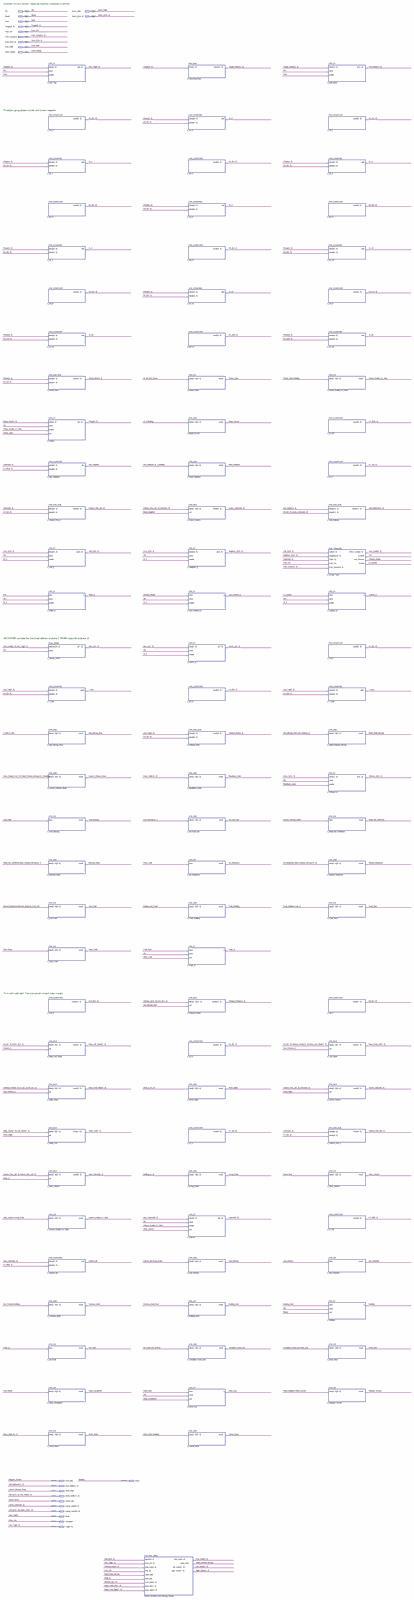
[diagram p0: schematic sheet, whole]
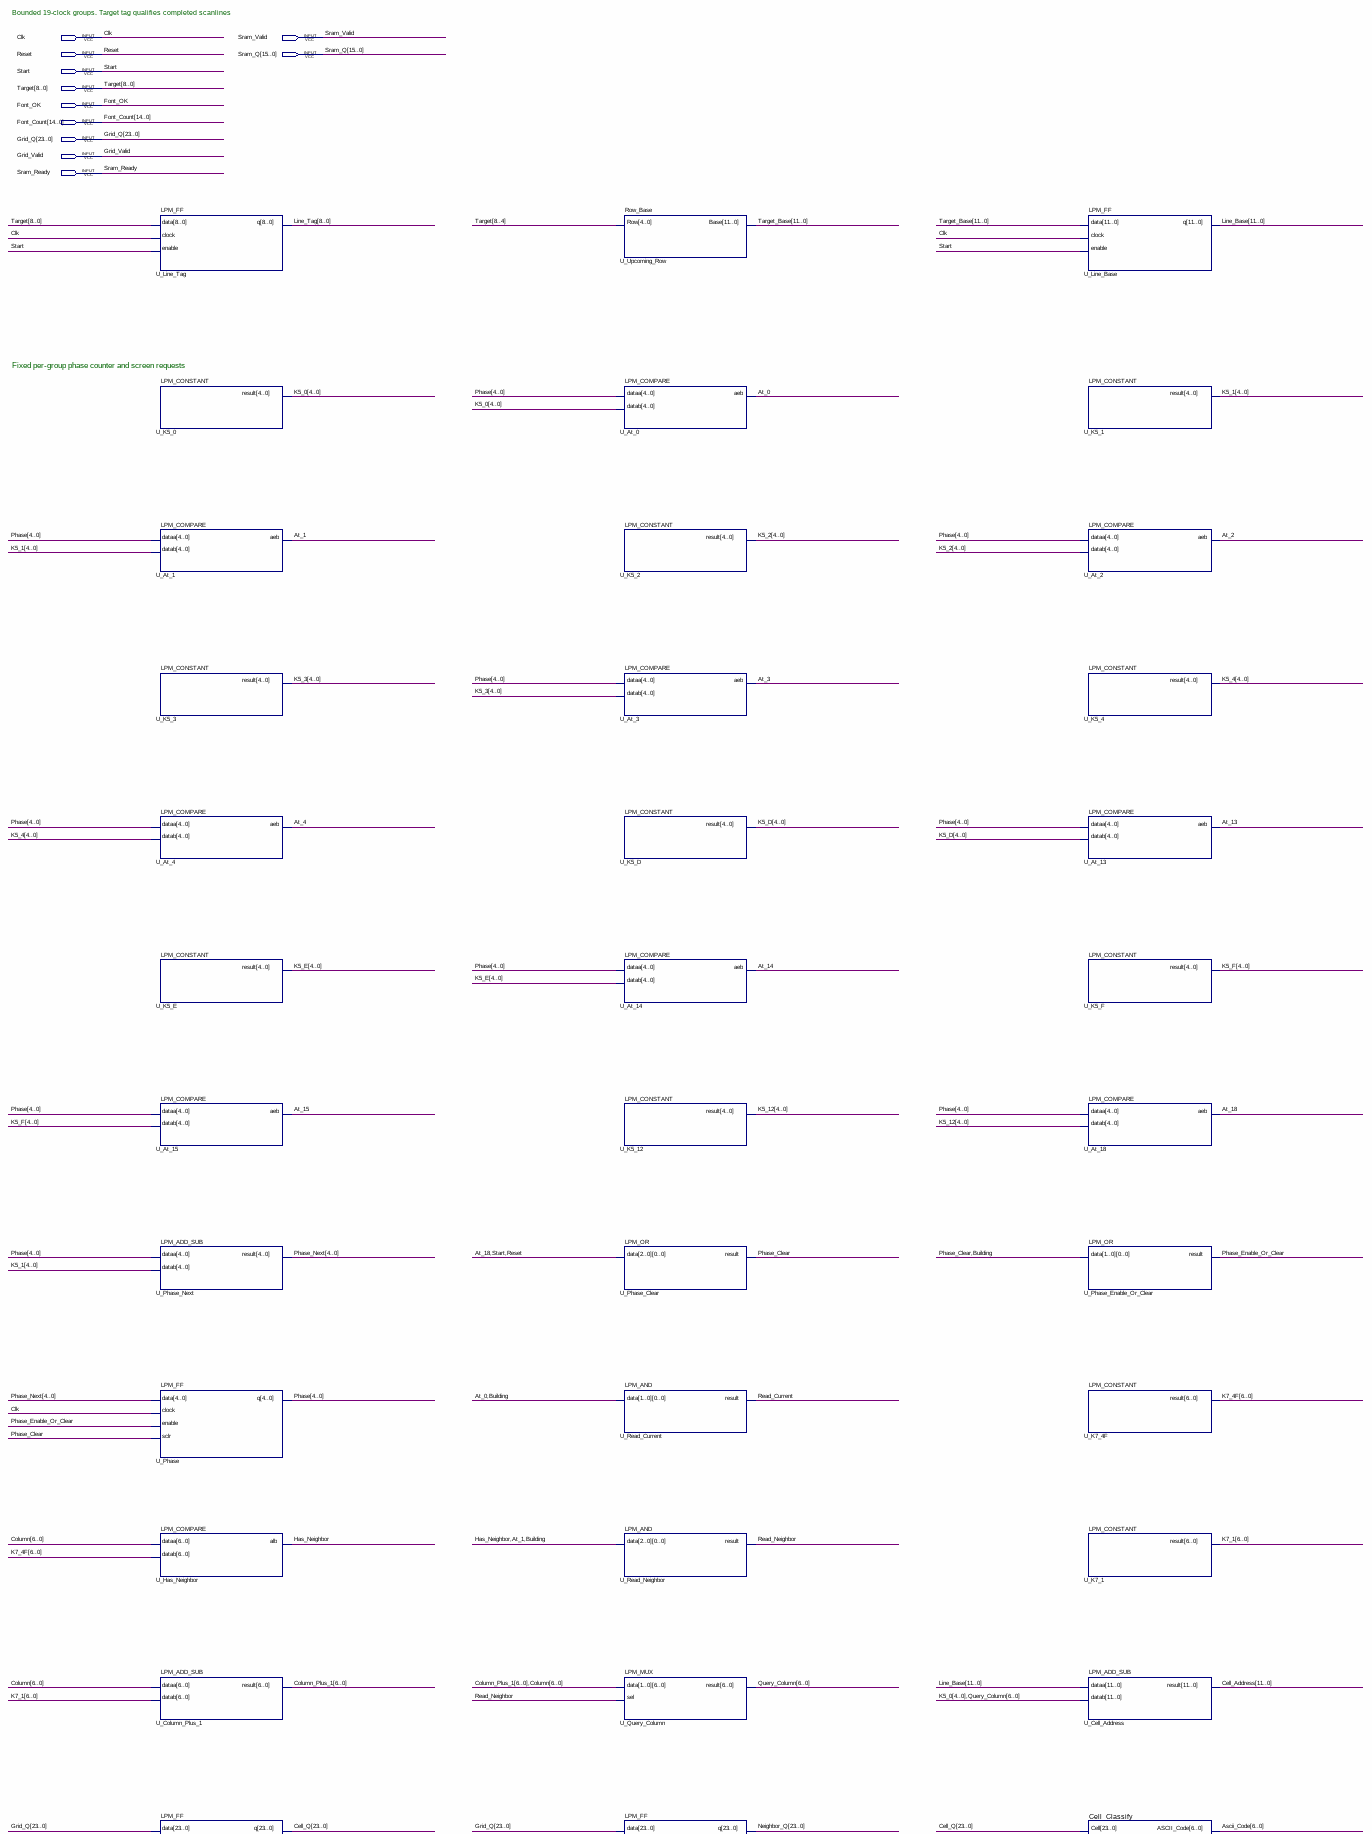
[diagram p1: schematic sheet, upper part]
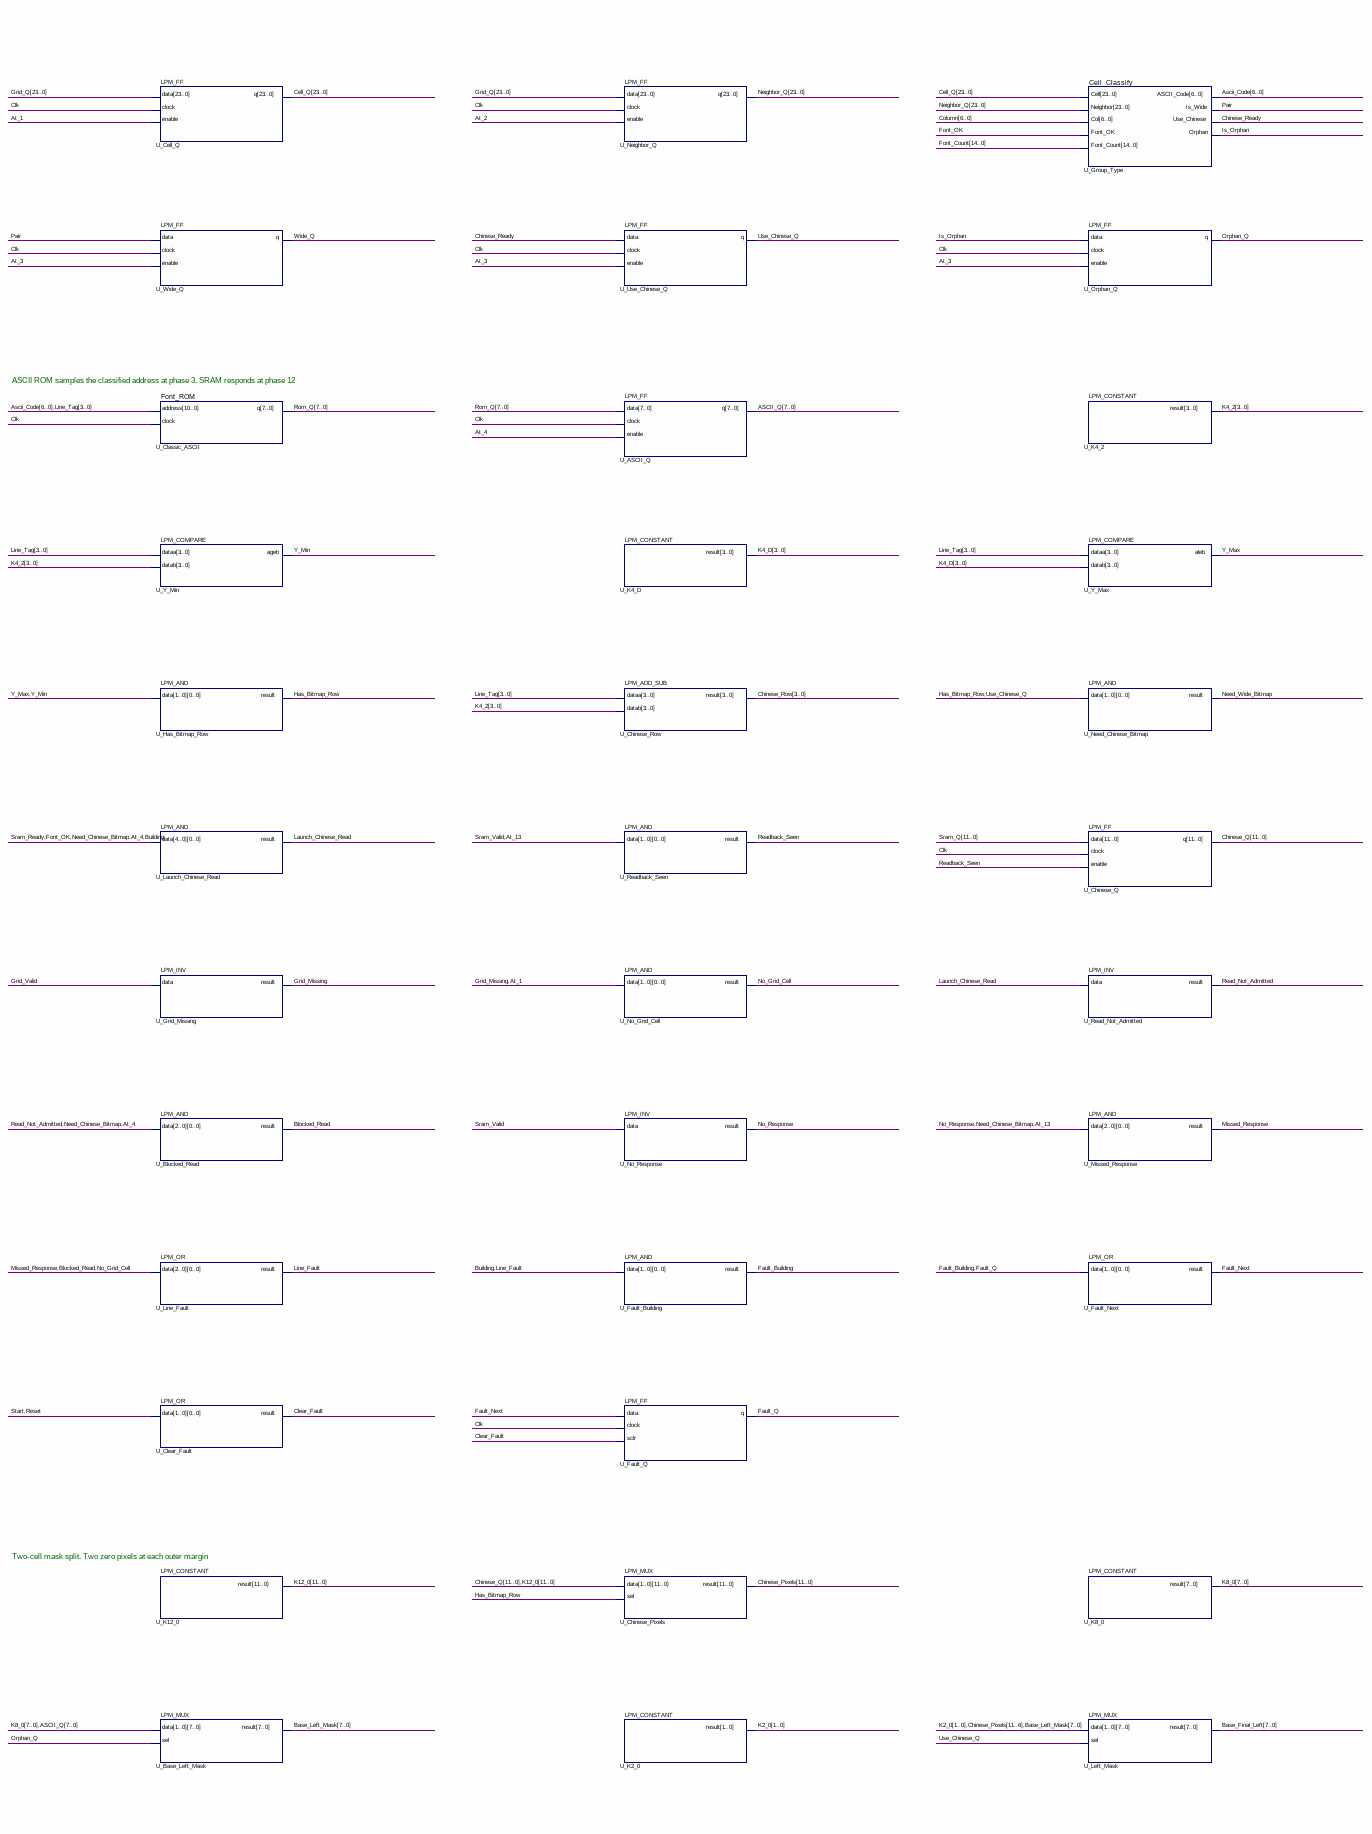
[diagram p2: schematic sheet, middle part]
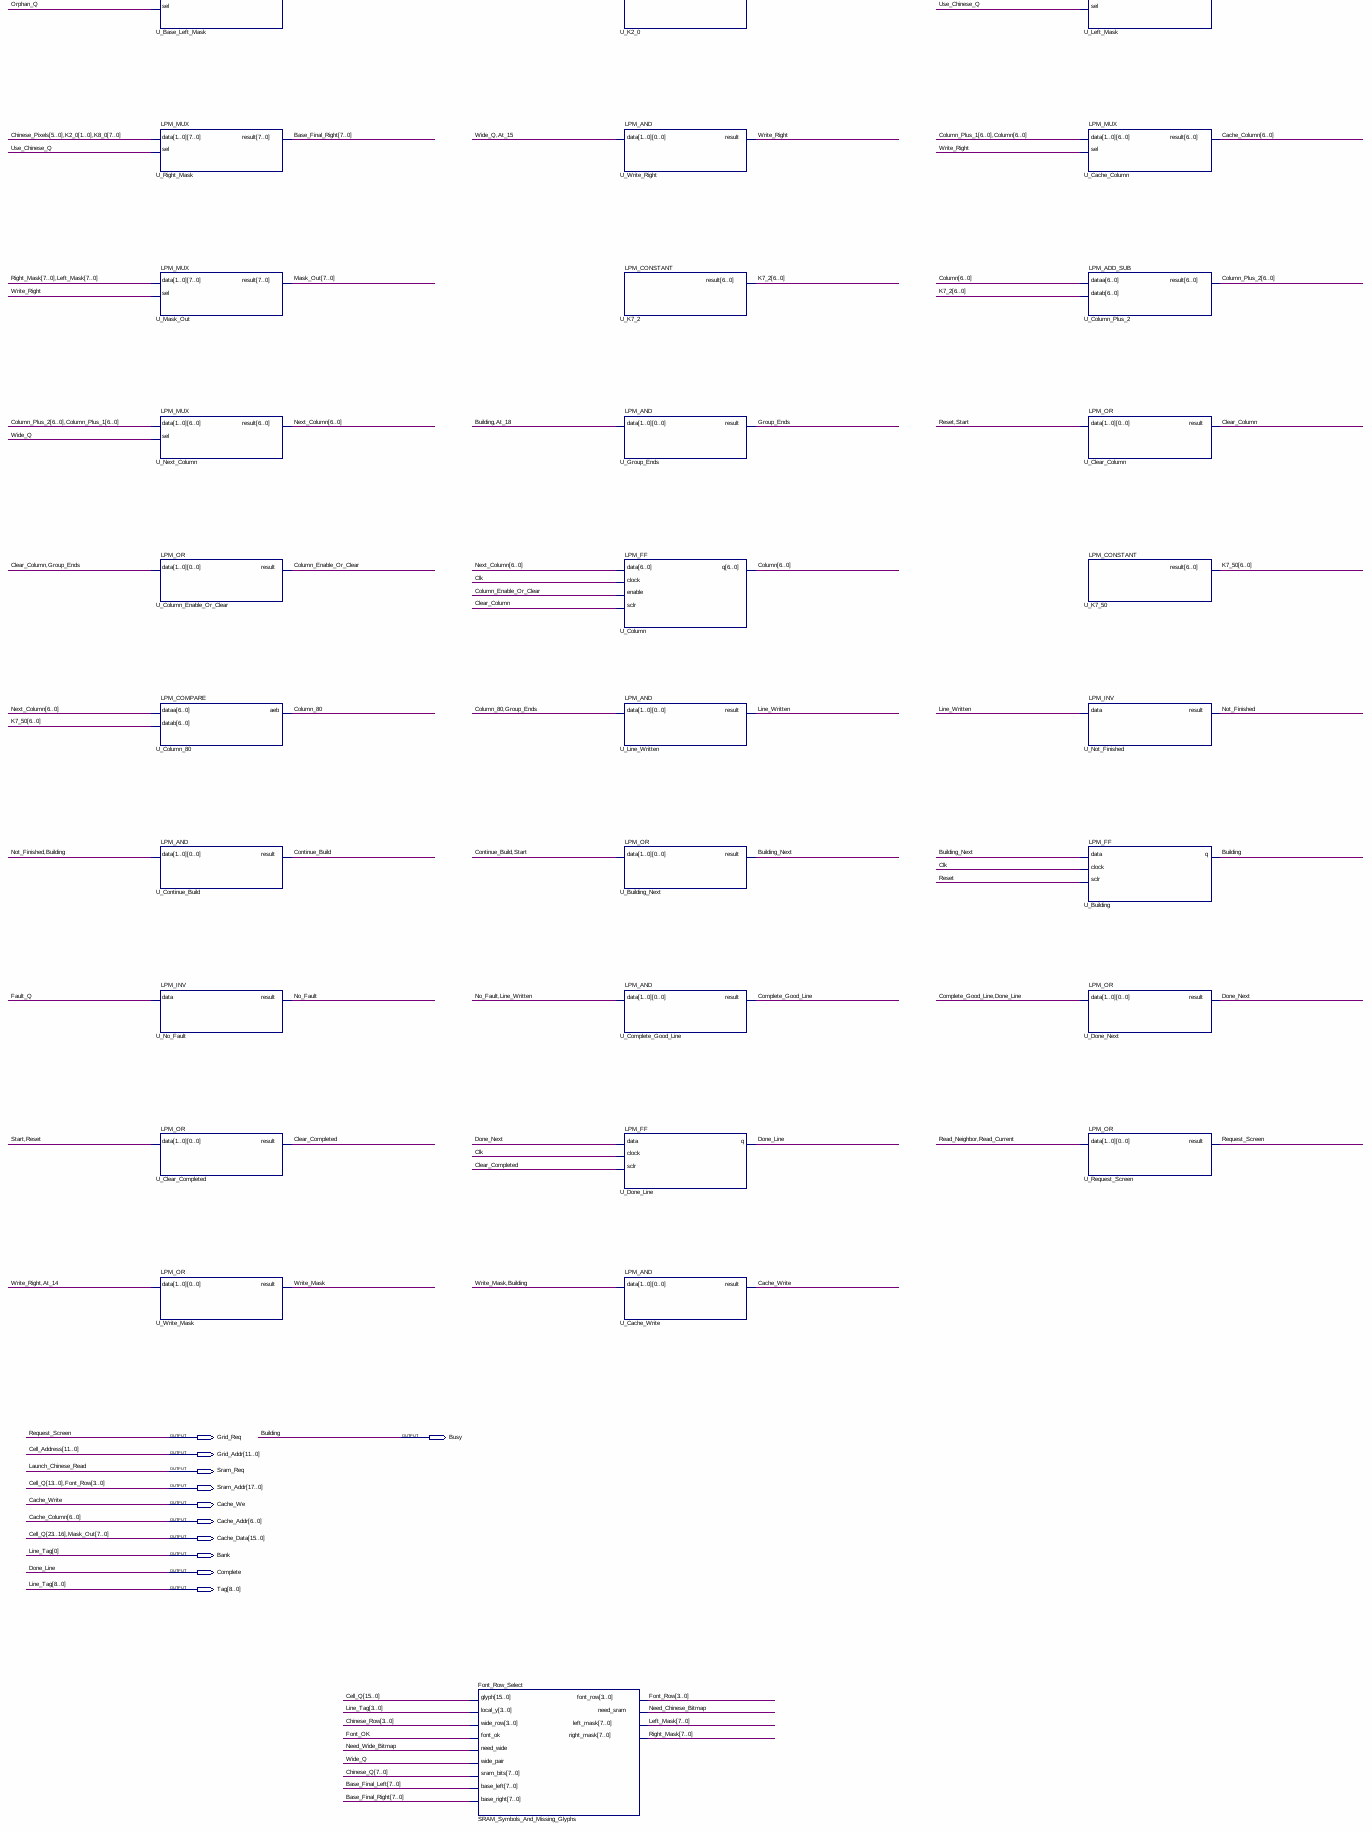
[diagram p3: schematic sheet, lower part]
// Quartus schematic Scanline_Builder.bdf as structural Verilog: 95 symbols, 22 pins
module Scanline_Builder (
  input  Clk,
  input  Sram_Valid,
  input  Reset,
  input  [15:0] Sram_Q,
  input  Start,
  input  [8:0] Target,
  input  Font_OK,
  input  [14:0] Font_Count,
  input  [23:0] Grid_Q,
  input  Grid_Valid,
  input  Sram_Ready,
  output Grid_Req,
  output Busy,
  output [11:0] Grid_Addr,
  output Sram_Req,
  output [17:0] Sram_Addr,
  output Cache_We,
  output [6:0] Cache_Addr,
  output [15:0] Cache_Data,
  output Bank,
  output Complete,
  output [8:0] Tag
);

  wire At_0, At_1, At_2, At_3, At_4, At_13, At_14, At_15, At_18, Blocked_Read, Building_Next, Chinese_Ready,
       Clear_Column, Clear_Completed, Clear_Fault, Column_80, Column_Enable_Or_Clear, Complete_Good_Line,
       Continue_Build, Done_Next, Fault_Building, Fault_Next, Fault_Q, Grid_Missing, Group_Ends,
       Has_Bitmap_Row, Has_Neighbor, Is_Orphan, Line_Fault, Line_Written, Missed_Response,
       Need_Chinese_Bitmap, Need_Wide_Bitmap, No_Fault, No_Grid_Cell, No_Response, Not_Finished, Orphan_Q,
       Pair, Phase_Clear, Phase_Enable_Or_Clear, Read_Current, Read_Neighbor, Read_Not_Admitted,
       Readback_Seen, Use_Chinese_Q, Wide_Q, Write_Mask, Write_Right, Y_Max, Y_Min;
  wire [1:0] K2_0;
  wire [3:0] Chinese_Row, K4_2, K4_D;
  wire [4:0] K5_0, K5_1, K5_2, K5_3, K5_4, K5_12, K5_D, K5_E, K5_F, Phase, Phase_Next;
  wire [6:0] Ascii_Code, Column, Column_Plus_1, Column_Plus_2, K7_1, K7_2, K7_4F, K7_50, Next_Column,
       Query_Column;
  wire [7:0] ASCII_Q, Base_Final_Left, Base_Final_Right, Base_Left_Mask, K8_0, Left_Mask, Right_Mask, Rom_Q;
  wire [11:0] Chinese_Pixels, Chinese_Q, K12_0, Line_Base, Target_Base;
  wire [15:14] Cell_Q;
  wire [23:0] Neighbor_Q;

  LPM_FF #(.LPM_WIDTH(9), .LPM_FFTYPE("DFF")) U_Line_Tag (
    .data(Target), .clock(Clk), .enable(Start), .q({Tag[8:1], Bank}));
  LPM_CONSTANT #(.LPM_WIDTH(5), .LPM_CVALUE(0)) U_K5_0 (.result(K5_0));
  LPM_COMPARE #(.LPM_WIDTH(5), .LPM_REPRESENTATION("UNSIGNED")) U_At_1 (.dataa(Phase), .datab(K5_1), .aeb(At_1));
  LPM_CONSTANT #(.LPM_WIDTH(5), .LPM_CVALUE(3)) U_K5_3 (.result(K5_3));
  LPM_COMPARE #(.LPM_WIDTH(5), .LPM_REPRESENTATION("UNSIGNED")) U_At_4 (.dataa(Phase), .datab(K5_4), .aeb(At_4));
  LPM_CONSTANT #(.LPM_WIDTH(5), .LPM_CVALUE(14)) U_K5_E (.result(K5_E));
  LPM_COMPARE #(.LPM_WIDTH(5), .LPM_REPRESENTATION("UNSIGNED")) U_At_15 (.dataa(Phase), .datab(K5_F), .aeb(At_15));
  LPM_ADD_SUB #(.LPM_WIDTH(5), .LPM_DIRECTION("ADD"), .LPM_REPRESENTATION("UNSIGNED")) U_Phase_Next (
    .dataa(Phase), .datab(K5_1), .result(Phase_Next));
  LPM_FF #(.LPM_WIDTH(5), .LPM_FFTYPE("DFF")) U_Phase (
    .data(Phase_Next), .clock(Clk), .enable(Phase_Enable_Or_Clear), .sclr(Phase_Clear), .q(Phase));
  LPM_COMPARE #(.LPM_WIDTH(7), .LPM_REPRESENTATION("UNSIGNED")) U_Has_Neighbor (
    .dataa(Column), .datab(K7_4F), .alb(Has_Neighbor));
  LPM_ADD_SUB #(.LPM_WIDTH(7), .LPM_DIRECTION("ADD"), .LPM_REPRESENTATION("UNSIGNED")) U_Column_Plus_1 (
    .dataa(Column), .datab(K7_1), .result(Column_Plus_1));
  LPM_FF #(.LPM_WIDTH(24), .LPM_FFTYPE("DFF")) U_Cell_Q (
    .data(Grid_Q), .clock(Clk), .enable(At_1), .q({Cache_Data[15:8], Cell_Q, Sram_Addr[17:4]}));
  LPM_FF #(.LPM_WIDTH(1), .LPM_FFTYPE("DFF")) U_Wide_Q (.data(Pair), .clock(Clk), .enable(At_3), .q(Wide_Q));
  Font_ROM U_Classic_ASCII (.address({Ascii_Code, Tag[3:1], Bank}), .clock(Clk), .q(Rom_Q));
  LPM_COMPARE #(.LPM_WIDTH(4), .LPM_REPRESENTATION("UNSIGNED")) U_Y_Min (
    .dataa({Tag[3:1], Bank}), .datab(K4_2), .ageb(Y_Min));
  LPM_AND #(.LPM_WIDTH(1), .LPM_SIZE(2)) U_Has_Bitmap_Row (.data({Y_Max, Y_Min}), .result(Has_Bitmap_Row));
  LPM_AND #(.LPM_WIDTH(1), .LPM_SIZE(5)) U_Launch_Chinese_Read (
    .data({Sram_Ready, Font_OK, Need_Chinese_Bitmap, At_4, Busy}), .result(Sram_Req));
  LPM_INV #(.LPM_WIDTH(1)) U_Grid_Missing (.data(Grid_Valid), .result(Grid_Missing));
  LPM_AND #(.LPM_WIDTH(1), .LPM_SIZE(3)) U_Blocked_Read (
    .data({Read_Not_Admitted, Need_Chinese_Bitmap, At_4}), .result(Blocked_Read));
  LPM_OR #(.LPM_WIDTH(1), .LPM_SIZE(3)) U_Line_Fault (
    .data({Missed_Response, Blocked_Read, No_Grid_Cell}), .result(Line_Fault));
  LPM_OR #(.LPM_WIDTH(1), .LPM_SIZE(2)) U_Clear_Fault (.data({Start, Reset}), .result(Clear_Fault));
  LPM_CONSTANT #(.LPM_WIDTH(12), .LPM_CVALUE(0)) U_K12_0 (.result(K12_0));
  LPM_MUX #(.LPM_WIDTH(8), .LPM_SIZE(2), .LPM_WIDTHS(1)) U_Base_Left_Mask (
    .data({K8_0, ASCII_Q}), .sel(Orphan_Q), .result(Base_Left_Mask));
  LPM_MUX #(.LPM_WIDTH(8), .LPM_SIZE(2), .LPM_WIDTHS(1)) U_Right_Mask (
    .data({Chinese_Pixels[5:0], K2_0, K8_0}), .sel(Use_Chinese_Q), .result(Base_Final_Right));
  LPM_MUX #(.LPM_WIDTH(8), .LPM_SIZE(2), .LPM_WIDTHS(1)) U_Mask_Out (
    .data({Right_Mask, Left_Mask}), .sel(Write_Right), .result(Cache_Data[7:0]));
  LPM_MUX #(.LPM_WIDTH(7), .LPM_SIZE(2), .LPM_WIDTHS(1)) U_Next_Column (
    .data({Column_Plus_2, Column_Plus_1}), .sel(Wide_Q), .result(Next_Column));
  LPM_OR #(.LPM_WIDTH(1), .LPM_SIZE(2)) U_Column_Enable_Or_Clear (
    .data({Clear_Column, Group_Ends}), .result(Column_Enable_Or_Clear));
  LPM_COMPARE #(.LPM_WIDTH(7), .LPM_REPRESENTATION("UNSIGNED")) U_Column_80 (
    .dataa(Next_Column), .datab(K7_50), .aeb(Column_80));
  LPM_AND #(.LPM_WIDTH(1), .LPM_SIZE(2)) U_Continue_Build (.data({Not_Finished, Busy}), .result(Continue_Build));
  LPM_INV #(.LPM_WIDTH(1)) U_No_Fault (.data(Fault_Q), .result(No_Fault));
  LPM_OR #(.LPM_WIDTH(1), .LPM_SIZE(2)) U_Clear_Completed (.data({Start, Reset}), .result(Clear_Completed));
  LPM_OR #(.LPM_WIDTH(1), .LPM_SIZE(2)) U_Write_Mask (.data({Write_Right, At_14}), .result(Write_Mask));
  Font_Row_Select SRAM_Symbols_And_Missing_Glyphs (
    .glyph({Cell_Q, Sram_Addr[17:4]}), .local_y({Tag[3:1], Bank}), .wide_row(Chinese_Row), .font_ok(Font_OK),
    .need_wide(Need_Wide_Bitmap), .wide_pair(Wide_Q), .sram_bits(Chinese_Q[7:0]),
    .base_left(Base_Final_Left), .base_right(Base_Final_Right), .font_row(Sram_Addr[3:0]),
    .need_sram(Need_Chinese_Bitmap), .left_mask(Left_Mask), .right_mask(Right_Mask));
  Row_Base U_Upcoming_Row (.Row(Target[8:4]), .Base(Target_Base));
  LPM_COMPARE #(.LPM_WIDTH(5), .LPM_REPRESENTATION("UNSIGNED")) U_At_0 (.dataa(Phase), .datab(K5_0), .aeb(At_0));
  LPM_CONSTANT #(.LPM_WIDTH(5), .LPM_CVALUE(2)) U_K5_2 (.result(K5_2));
  LPM_COMPARE #(.LPM_WIDTH(5), .LPM_REPRESENTATION("UNSIGNED")) U_At_3 (.dataa(Phase), .datab(K5_3), .aeb(At_3));
  LPM_CONSTANT #(.LPM_WIDTH(5), .LPM_CVALUE(13)) U_K5_D (.result(K5_D));
  LPM_COMPARE #(.LPM_WIDTH(5), .LPM_REPRESENTATION("UNSIGNED")) U_At_14 (.dataa(Phase), .datab(K5_E), .aeb(At_14));
  LPM_CONSTANT #(.LPM_WIDTH(5), .LPM_CVALUE(18)) U_K5_12 (.result(K5_12));
  LPM_OR #(.LPM_WIDTH(1), .LPM_SIZE(3)) U_Phase_Clear (.data({At_18, Start, Reset}), .result(Phase_Clear));
  LPM_AND #(.LPM_WIDTH(1), .LPM_SIZE(2)) U_Read_Current (.data({At_0, Busy}), .result(Read_Current));
  LPM_AND #(.LPM_WIDTH(1), .LPM_SIZE(3)) U_Read_Neighbor (.data({Has_Neighbor, At_1, Busy}), .result(Read_Neighbor));
  LPM_MUX #(.LPM_WIDTH(7), .LPM_SIZE(2), .LPM_WIDTHS(1)) U_Query_Column (
    .data({Column_Plus_1, Column}), .sel(Read_Neighbor), .result(Query_Column));
  LPM_FF #(.LPM_WIDTH(24), .LPM_FFTYPE("DFF")) U_Neighbor_Q (.data(Grid_Q), .clock(Clk), .enable(At_2), .q(Neighbor_Q));
  LPM_FF #(.LPM_WIDTH(1), .LPM_FFTYPE("DFF")) U_Use_Chinese_Q (
    .data(Chinese_Ready), .clock(Clk), .enable(At_3), .q(Use_Chinese_Q));
  LPM_FF #(.LPM_WIDTH(8), .LPM_FFTYPE("DFF")) U_ASCII_Q (.data(Rom_Q), .clock(Clk), .enable(At_4), .q(ASCII_Q));
  LPM_CONSTANT #(.LPM_WIDTH(4), .LPM_CVALUE(13)) U_K4_D (.result(K4_D));
  LPM_ADD_SUB #(.LPM_WIDTH(4), .LPM_DIRECTION("SUB"), .LPM_REPRESENTATION("UNSIGNED")) U_Chinese_Row (
    .dataa({Tag[3:1], Bank}), .datab(K4_2), .result(Chinese_Row));
  LPM_AND #(.LPM_WIDTH(1), .LPM_SIZE(2)) U_Readback_Seen (.data({Sram_Valid, At_13}), .result(Readback_Seen));
  LPM_AND #(.LPM_WIDTH(1), .LPM_SIZE(2)) U_No_Grid_Cell (.data({Grid_Missing, At_1}), .result(No_Grid_Cell));
  LPM_INV #(.LPM_WIDTH(1)) U_No_Response (.data(Sram_Valid), .result(No_Response));
  LPM_AND #(.LPM_WIDTH(1), .LPM_SIZE(2)) U_Fault_Building (.data({Busy, Line_Fault}), .result(Fault_Building));
  LPM_FF #(.LPM_WIDTH(1), .LPM_FFTYPE("DFF")) U_Fault_Q (
    .data(Fault_Next), .clock(Clk), .sclr(Clear_Fault), .q(Fault_Q));
  LPM_MUX #(.LPM_WIDTH(12), .LPM_SIZE(2), .LPM_WIDTHS(1)) U_Chinese_Pixels (
    .data({Chinese_Q, K12_0}), .sel(Has_Bitmap_Row), .result(Chinese_Pixels));
  LPM_CONSTANT #(.LPM_WIDTH(2), .LPM_CVALUE(0)) U_K2_0 (.result(K2_0));
  LPM_AND #(.LPM_WIDTH(1), .LPM_SIZE(2)) U_Write_Right (.data({Wide_Q, At_15}), .result(Write_Right));
  LPM_CONSTANT #(.LPM_WIDTH(7), .LPM_CVALUE(2)) U_K7_2 (.result(K7_2));
  LPM_AND #(.LPM_WIDTH(1), .LPM_SIZE(2)) U_Group_Ends (.data({Busy, At_18}), .result(Group_Ends));
  LPM_FF #(.LPM_WIDTH(7), .LPM_FFTYPE("DFF")) U_Column (
    .data(Next_Column), .clock(Clk), .enable(Column_Enable_Or_Clear), .sclr(Clear_Column), .q(Column));
  LPM_AND #(.LPM_WIDTH(1), .LPM_SIZE(2)) U_Line_Written (.data({Column_80, Group_Ends}), .result(Line_Written));
  LPM_OR #(.LPM_WIDTH(1), .LPM_SIZE(2)) U_Building_Next (.data({Continue_Build, Start}), .result(Building_Next));
  LPM_AND #(.LPM_WIDTH(1), .LPM_SIZE(2)) U_Complete_Good_Line (
    .data({No_Fault, Line_Written}), .result(Complete_Good_Line));
  LPM_FF #(.LPM_WIDTH(1), .LPM_FFTYPE("DFF")) U_Done_Line (
    .data(Done_Next), .clock(Clk), .sclr(Clear_Completed), .q(Complete));
  LPM_AND #(.LPM_WIDTH(1), .LPM_SIZE(2)) U_Cache_Write (.data({Write_Mask, Busy}), .result(Cache_We));
  LPM_FF #(.LPM_WIDTH(12), .LPM_FFTYPE("DFF")) U_Line_Base (
    .data(Target_Base), .clock(Clk), .enable(Start), .q(Line_Base));
  LPM_CONSTANT #(.LPM_WIDTH(5), .LPM_CVALUE(1)) U_K5_1 (.result(K5_1));
  LPM_COMPARE #(.LPM_WIDTH(5), .LPM_REPRESENTATION("UNSIGNED")) U_At_2 (.dataa(Phase), .datab(K5_2), .aeb(At_2));
  LPM_CONSTANT #(.LPM_WIDTH(5), .LPM_CVALUE(4)) U_K5_4 (.result(K5_4));
  LPM_COMPARE #(.LPM_WIDTH(5), .LPM_REPRESENTATION("UNSIGNED")) U_At_13 (.dataa(Phase), .datab(K5_D), .aeb(At_13));
  LPM_CONSTANT #(.LPM_WIDTH(5), .LPM_CVALUE(15)) U_K5_F (.result(K5_F));
  LPM_COMPARE #(.LPM_WIDTH(5), .LPM_REPRESENTATION("UNSIGNED")) U_At_18 (.dataa(Phase), .datab(K5_12), .aeb(At_18));
  LPM_OR #(.LPM_WIDTH(1), .LPM_SIZE(2)) U_Phase_Enable_Or_Clear (
    .data({Phase_Clear, Busy}), .result(Phase_Enable_Or_Clear));
  LPM_CONSTANT #(.LPM_WIDTH(7), .LPM_CVALUE(79)) U_K7_4F (.result(K7_4F));
  LPM_CONSTANT #(.LPM_WIDTH(7), .LPM_CVALUE(1)) U_K7_1 (.result(K7_1));
  LPM_ADD_SUB #(.LPM_WIDTH(12), .LPM_DIRECTION("ADD"), .LPM_REPRESENTATION("UNSIGNED")) U_Cell_Address (
    .dataa(Line_Base), .datab({K5_0, Query_Column}), .result(Grid_Addr));
  Cell_Classify U_Group_Type (
    .Cell({Cache_Data[15:8], Cell_Q, Sram_Addr[17:4]}), .Neighbor(Neighbor_Q), .Col(Column),
    .Font_OK(Font_OK), .Font_Count(Font_Count), .ASCII_Code(Ascii_Code), .Is_Wide(Pair),
    .Use_Chinese(Chinese_Ready), .Orphan(Is_Orphan));
  LPM_FF #(.LPM_WIDTH(1), .LPM_FFTYPE("DFF")) U_Orphan_Q (.data(Is_Orphan), .clock(Clk), .enable(At_3), .q(Orphan_Q));
  LPM_CONSTANT #(.LPM_WIDTH(4), .LPM_CVALUE(2)) U_K4_2 (.result(K4_2));
  LPM_COMPARE #(.LPM_WIDTH(4), .LPM_REPRESENTATION("UNSIGNED")) U_Y_Max (
    .dataa({Tag[3:1], Bank}), .datab(K4_D), .aleb(Y_Max));
  LPM_AND #(.LPM_WIDTH(1), .LPM_SIZE(2)) U_Need_Chinese_Bitmap (
    .data({Has_Bitmap_Row, Use_Chinese_Q}), .result(Need_Wide_Bitmap));
  LPM_FF #(.LPM_WIDTH(12), .LPM_FFTYPE("DFF")) U_Chinese_Q (
    .data(Sram_Q[11:0]), .clock(Clk), .enable(Readback_Seen), .q(Chinese_Q));
  LPM_INV #(.LPM_WIDTH(1)) U_Read_Not_Admitted (.data(Sram_Req), .result(Read_Not_Admitted));
  LPM_AND #(.LPM_WIDTH(1), .LPM_SIZE(3)) U_Missed_Response (
    .data({No_Response, Need_Chinese_Bitmap, At_13}), .result(Missed_Response));
  LPM_OR #(.LPM_WIDTH(1), .LPM_SIZE(2)) U_Fault_Next (.data({Fault_Building, Fault_Q}), .result(Fault_Next));
  LPM_CONSTANT #(.LPM_WIDTH(8), .LPM_CVALUE(0)) U_K8_0 (.result(K8_0));
  LPM_MUX #(.LPM_WIDTH(8), .LPM_SIZE(2), .LPM_WIDTHS(1)) U_Left_Mask (
    .data({K2_0, Chinese_Pixels[11:6], Base_Left_Mask}), .sel(Use_Chinese_Q), .result(Base_Final_Left));
  LPM_MUX #(.LPM_WIDTH(7), .LPM_SIZE(2), .LPM_WIDTHS(1)) U_Cache_Column (
    .data({Column_Plus_1, Column}), .sel(Write_Right), .result(Cache_Addr));
  LPM_ADD_SUB #(.LPM_WIDTH(7), .LPM_DIRECTION("ADD"), .LPM_REPRESENTATION("UNSIGNED")) U_Column_Plus_2 (
    .dataa(Column), .datab(K7_2), .result(Column_Plus_2));
  LPM_OR #(.LPM_WIDTH(1), .LPM_SIZE(2)) U_Clear_Column (.data({Reset, Start}), .result(Clear_Column));
  LPM_CONSTANT #(.LPM_WIDTH(7), .LPM_CVALUE(80)) U_K7_50 (.result(K7_50));
  LPM_INV #(.LPM_WIDTH(1)) U_Not_Finished (.data(Line_Written), .result(Not_Finished));
  LPM_FF #(.LPM_WIDTH(1), .LPM_FFTYPE("DFF")) U_Building (.data(Building_Next), .clock(Clk), .sclr(Reset), .q(Busy));
  LPM_OR #(.LPM_WIDTH(1), .LPM_SIZE(2)) U_Done_Next (.data({Complete_Good_Line, Complete}), .result(Done_Next));
  LPM_OR #(.LPM_WIDTH(1), .LPM_SIZE(2)) U_Request_Screen (.data({Read_Neighbor, Read_Current}), .result(Grid_Req));

  assign Tag[0] = Bank;

  // Other names for the same wires on the sheet: Building = Busy; Cache_Column[6:0] = Cache_Addr;
  //   Cache_Write = Cache_We; Cell_Address[11:0] = Grid_Addr;
  //   Cell_Q (some bits) = {Cache_Data[15:8], Sram_Addr[17:4]}; Done_Line = Complete; Font_Row[3:0] = Sram_Addr[3:0];
  //   Launch_Chinese_Read = Sram_Req; Line_Tag[8:0] = {Tag[8:1], Bank}; Mask_Out[7:0] = Cache_Data[7:0];
  //   Request_Screen = Grid_Req

  // Notes on the sheet:
  //   Bounded 19-clock groups. Target tag qualifies completed scanlines
  //   Fixed per-group phase counter and screen requests
  //   ASCII ROM samples the classified address at phase 3. SRAM responds at phase 12
  //   Two-cell mask split. Two zero pixels at each outer margin
endmodule
